# Altium schematic sheet PAGE1.SchDoc
size 246 x 182 mm
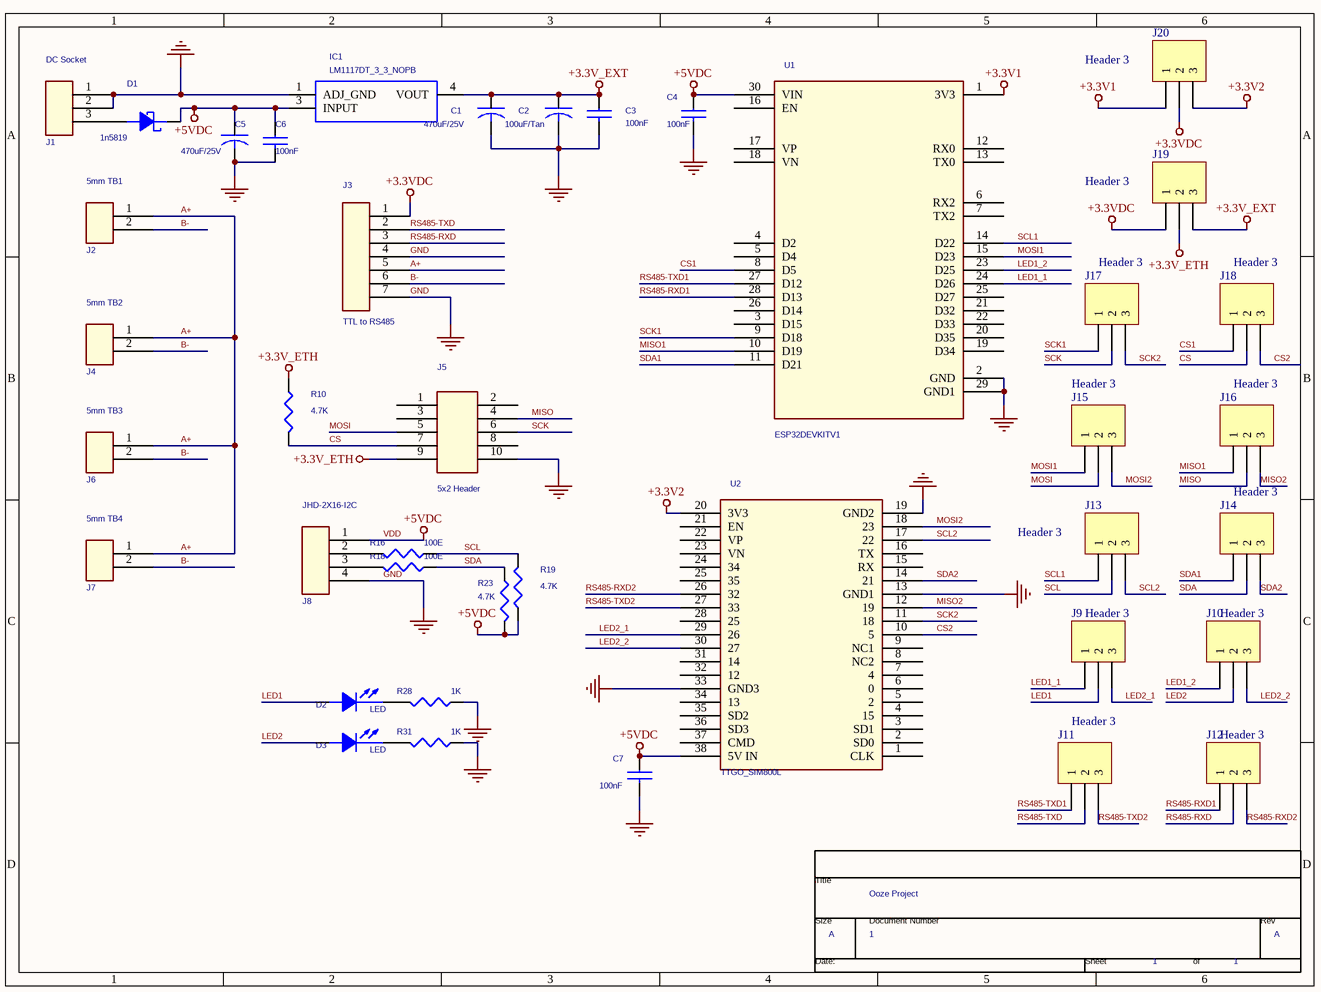
[diagram p0: PAGE1.SchDoc]

## Parts
*  Doc: 1  RevCode: A  Title: Ooze Project  (hidden comment: TitleBlock0)  (graphical)
C1  470uF/25V  [CAP_through_hole_470mfd]
C2  100uF/Tan  [Tantalum-1210C]
C3  100nF  [SMD-0603C]
C4  100nF  [SMD-0603C]
C5  470uF/25V  [CAP_through_hole_470mfd]
C6  100nF  [SMD-0603C]
C7  100nF  [SMD-0603C]
D1  1n5819  [IN5819 SCHOTTKY DIODE]
D2  LED  [3mm Led1 - single Side]
D3  LED  [3mm Led1 - single Side]
IC1  LM1117DT_3_3_NOPB  [LM1117DT_3_3_NOPB]
J1  DC Socket  [DC Socket]
J2  5mm TB1  [2PIN TB-Single Side]
J3  TTL to RS485  [RS485-TTL Module]
J4  5mm TB2  [2PIN TB-Single Side]
J5  5x2 Header  [HDR2X5]
J6  5mm TB3  [2PIN TB-Single Side]
J7  5mm TB4  [2PIN TB-Single Side]
J8  JHD-2X16-I2C  [4 pin connector-Single Side]
J9  Header 3  [3 pin connector - Sinle Side]
J10  Header 3  [3 pin connector - Sinle Side]
J11  Header 3  [3 pin connector - Sinle Side]
J12  Header 3  [3 pin connector - Sinle Side]
J13  Header 3  [3 pin connector - Sinle Side]
J14  Header 3  [3 pin connector - Sinle Side]
J15  Header 3  [3 pin connector - Sinle Side]
J16  Header 3  [3 pin connector - Sinle Side]
J17  Header 3  [3 pin connector - Sinle Side]
J18  Header 3  [3 pin connector - Sinle Side]
J19  Header 3  [3 pin connector - Sinle Side]
J20  Header 3  [3 pin connector - Sinle Side]
R10  4.7K  [SMD-0603-RES]
R16  100E  [SMD-0603-RES]
R18  100E  [SMD-0603-RES]
R19  4.7K  [SMD-0603-RES]
R23  4.7K  [SMD-0603-RES]
R28  1K  [SMD-0603-RES]
R31  1K  [SMD-0603-RES]
U1  ESP32DEVKITV1  [ESP32DEVKITV1- single side]
U2  TTGO_SIM800L  [TTGO_SIM800L-Single Side]

## Nets
+3.3V1: J20.1 U1.1(3V3)
+3.3V2: J20.3 U2.20(3V3)
+3.3V_ETH: J5.9 J19.2 R10.1
+3.3V_EXT: C1.1 C2.1 C3.1 IC1.4(VOUT) J19.3
+3.3VDC: J3.1 J19.1 J20.2
GND: C1.2 C2.2 C3.2 C4.2 C5.2 C6.2 C7.2 IC1.1(ADJ_GND) J1.1 J1.2 J3.4 J3.7 J5.10 J8.4 R28.1 R31.1 U1.2(GND) U1.29(GND1) U2.13(GND1) U2.19(GND2) U2.33(GND3)
VDD: C4.1 C5.1 C6.1 C7.1 D1.C(CATHODE) IC1.3(INPUT) J8.1 R19.1 R23.2 U1.30(VIN) U2.38(5V_IN)  [also labelled +5VDC]
A+: J2.1 J3.5 J4.1 J6.1 J7.1
B-: J2.2 J3.6 J4.2 J6.2 J7.2
CS: J5.7 J18.2 R10.2
CS1: J18.1 U1.8(D5)
CS2: J18.3 U2.10(5)
LED1: D2.2(ANODE) J9.2
LED1_1: J9.1 U1.24(D26)
LED1_2: J10.1 U1.23(D25)
LED2: D3.2(ANODE) J10.2
LED2_1: J9.3 U2.29(26)
LED2_2: J10.3 U2.30(27)
MISO: J5.4 J16.2
MISO1: J16.1 U1.10(D19)
MISO2: J16.3 U2.12(19)
MOSI: J5.5 J15.2
MOSI1: J15.1 U1.15(D23)
MOSI2: J15.3 U2.18(23)
RS485-RXD: J3.3 J12.2
RS485-RXD1: J12.1 U1.28(D13)
RS485-RXD2: J12.3 U2.26(32)
RS485-TXD: J3.2 J11.2
RS485-TXD1: J11.1 U1.27(D12)
RS485-TXD2: J11.3 U2.27(33)
SCK: J5.6 J17.2
SCK1: J17.1 U1.9(D18)
SCK2: J17.3 U2.11(18)
SCL: J13.2 R16.1 R19.2
SCL1: J13.1 U1.14(D22)
SCL2: J13.3 U2.17(22)
SDA: J14.2 R18.1 R23.1
SDA1: J14.1 U1.11(D21)
SDA2: J14.3 U2.14(21)
NetD1_A: D1.A(ANODE) J1.3
NetD2_1: D2.1(CATHODE) R28.2
NetD3_1: D3.1(CATHODE) R31.2
NetJ8_2: J8.2 R16.2
NetJ8_3: J8.3 R18.2

Not connected (* = marked no-connect by the designer): J5 1 2 3 8; U1 3(D15) 4(D2) 5(D4) 6(RX2) 7(TX2) 12(RX0) 13(TX0) 16(EN) 17(VP) 18(VN) 19(D34) 20(D35) 21(D32) 22(D33) 25(D27) 26(D14); U2 1(CLK) 2(SD0) 3(SD1) 4(15) 5(2) 6(0) 7(4) 8(NC2) 9(NC1) 15(RX) 16(TX) 21(EN) 22(VP) 23(VN) 24(34) 25(35) 28(25) 31(14) 32(12) 34(13) 35(SD2) 36(SD3) 37(CMD)

## Notes on the sheet
- (in symbol TitleBlock0) Title; Size; Document Number; Rev; Date:; Sheet; of

## Library data of the parts
C1 C2 C5 = CAP
C3 C4 C6 C7 = CAP NP
D1 = DIODE SCHOTTKY
IC1 = LM1117DT_3_3_NOPB: Space saving 800-mA low-dropout linear regulator with internal current limit; Manufacturer_Name: Texas Instruments; Manufacturer_Part_Number: LM1117DT-3.3/NOPB; IsHeterogeneous: False; DevicesInView: 1; DeviceDesignator: A; DeviceNumbering: Alpha; OriginalSymbolOrigin: (0,0); PackageName: LM1117DT_3_3_NOPB; DevicesInPackage: 1; Mouser Part Number: 926-LM1117DT-3.3NOPB; Datasheet Link: https://datasheet.datasheetarchive.com/originals/distributors/Datasheets-SFU2/DSASFU100036103.pdf; Height: 2.38 mm
J1 = CON3
J2 J4 J6 J7 = CON2
J3 = CON7
J5 = CON10AP_0
J8 = CON4
J9-J20 = Header 3: Header, 3-Pin; LatestRevisionDate: 17-Jul-2002; LatestRevisionNote: Re-released for DXP Platform.; Publisher: Altium Limited
R10 R16 R18 R19 R23 R28 R31 = RESISTOR
* = TitleBlock0: Page Create Date: March  8, 1995; Page Size: A; Page Number: 1; Page Count: 1